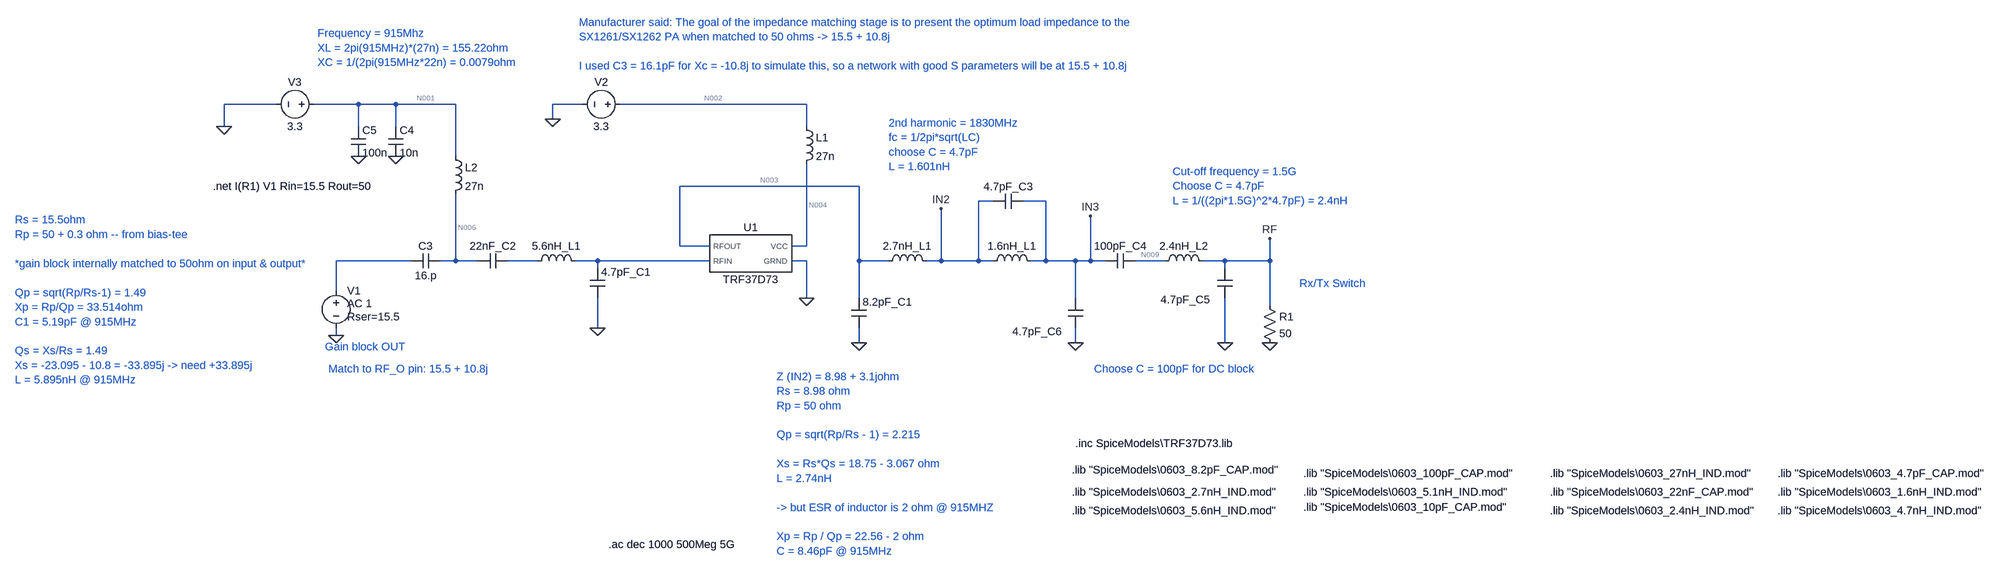
[diagram p0: schematic RF_FrontEnd_Real.asc]
RF_FrontEnd_Real.asc, the LTspice schematic file:
Version 4.1
SHEET 1 3572 756
WIRE -688 -208 -800 -208
WIRE -512 -208 -608 -208
WIRE -432 -208 -512 -208
WIRE -304 -208 -432 -208
WIRE -32 -208 -96 -208
WIRE 448 -208 48 -208
WIRE -96 -176 -96 -208
WIRE -800 -160 -800 -208
WIRE -512 -160 -512 -208
WIRE -432 -160 -432 -208
WIRE 448 -160 448 -208
WIRE -304 -96 -304 -208
WIRE 560 -32 176 -32
WIRE 848 0 816 0
WIRE 960 0 912 0
WIRE 176 96 176 -32
WIRE 240 96 176 96
WIRE 448 96 448 -80
WIRE 448 96 416 96
WIRE -400 128 -560 128
WIRE -304 128 -304 -16
WIRE -304 128 -336 128
WIRE -256 128 -304 128
WIRE -128 128 -192 128
WIRE 0 128 -48 128
WIRE 240 128 0 128
WIRE 448 128 416 128
WIRE 560 128 560 -32
WIRE 624 128 560 128
WIRE 736 128 736 16
WIRE 736 128 704 128
WIRE 816 128 816 0
WIRE 816 128 736 128
WIRE 848 128 816 128
WIRE 960 128 960 0
WIRE 960 128 928 128
WIRE 1024 128 960 128
WIRE 1056 128 1056 32
WIRE 1056 128 1024 128
WIRE 1088 128 1056 128
WIRE 1216 128 1152 128
WIRE 1344 128 1296 128
WIRE 1440 128 1440 80
WIRE 1440 128 1344 128
WIRE 0 144 0 128
WIRE 1344 144 1344 128
WIRE -560 192 -560 128
WIRE 448 208 448 128
WIRE 560 208 560 128
WIRE 1024 208 1024 128
WIRE 1440 224 1440 128
WIRE 0 272 0 208
WIRE -560 288 -560 272
WIRE 560 304 560 272
WIRE 1024 304 1024 272
WIRE 1344 304 1344 208
FLAG -560 288 0
FLAG 1440 304 0
FLAG 1440 80 RF
FLAG 1344 304 0
FLAG 1024 304 0
FLAG 1056 32 IN3
FLAG 560 304 0
FLAG 736 16 IN2
FLAG 448 208 0
FLAG -96 -176 0
FLAG 0 272 0
FLAG -800 -160 0
FLAG -512 -96 0
FLAG -432 -96 0
SYMBOL voltage -560 176 R0
WINDOW 3 -261 44 Left 2
WINDOW 123 24 44 Left 2
WINDOW 39 24 72 Left 2
SYMATTR Value ""
SYMATTR Value2 AC 1
SYMATTR SpiceLine Rser=15.5
SYMATTR InstName V1
SYMBOL res 1424 208 R0
SYMATTR InstName R1
SYMATTR Value 50
SYMBOL cap 912 -16 R90
WINDOW 0 0 32 VBottom 2
WINDOW 3 32 32 Invisible 2
SYMATTR InstName 4.7pF_C3
SYMATTR Value CL10C4R7BB8NNN_Precise_DC0V_25degC
SYMATTR Prefix X
SYMBOL ind 1200 144 R270
WINDOW 0 32 56 VTop 2
WINDOW 3 5 56 Invisible 2
SYMATTR InstName 2.4nH_L2
SYMATTR Value LQG18HN2N7S00
SYMATTR Prefix X
SYMATTR SpiceLine Rser=1m
SYMBOL cap 1328 144 R0
WINDOW 0 -122 67 Left 2
WINDOW 3 24 56 Invisible 2
SYMATTR InstName 4.7pF_C5
SYMATTR Value CL10C4R7BB8NNN_Precise_DC0V_25degC
SYMATTR Prefix X
SYMBOL cap 1152 112 R90
WINDOW 0 0 32 VBottom 2
WINDOW 3 32 32 Invisible 2
SYMATTR InstName 100pF_C4
SYMATTR Value GRM1555C1H101JA01_DC0V_25degC
SYMATTR Prefix X
SYMBOL cap 1008 208 R0
WINDOW 0 -119 72 Left 2
WINDOW 3 -49 69 Invisible 2
SYMATTR InstName 4.7pF_C6
SYMATTR Value CL10C4R7BB8NNN_Precise_DC0V_25degC
SYMATTR Prefix X
SYMBOL ind 832 144 R270
WINDOW 0 32 56 VTop 2
WINDOW 3 4 56 Invisible 2
SYMATTR InstName 1.6nH_L1
SYMATTR Value LQW18AS1N6J00
SYMATTR Prefix X
SYMBOL ind 608 144 R270
WINDOW 0 32 56 VTop 2
WINDOW 3 5 56 Invisible 2
SYMATTR InstName 2.7nH_L1
SYMATTR Value LQW15AN2N7B8Z
SYMATTR Prefix X
SYMBOL cap 544 208 R0
WINDOW 3 24 56 Invisible 2
SYMATTR Value GRM1885C1H8R2BA01_DC0V_25degC
SYMATTR InstName 8.2pF_C1
SYMATTR Prefix X
SYMBOL SpiceModels\\TRF37D73 320 112 R0
SYMATTR InstName U1
SYMBOL voltage 64 -208 R90
WINDOW 0 -32 56 VBottom 2
WINDOW 3 32 56 VTop 2
WINDOW 123 0 0 Left 0
WINDOW 39 0 0 Left 0
SYMATTR InstName V2
SYMATTR Value 3.3
SYMBOL cap -16 144 R0
WINDOW 3 24 56 Invisible 2
SYMATTR InstName 4.7pF_C1
SYMATTR Value CL10C4R7BB8NNN_Precise_DC0V_25degC
SYMATTR Prefix X
SYMBOL ind -144 144 R270
WINDOW 0 32 56 VTop 2
WINDOW 3 5 56 Invisible 2
SYMATTR InstName 5.6nH_L1
SYMATTR Value LQG18HN5N6S00
SYMATTR Prefix X
SYMATTR SpiceLine Rser=1m
SYMBOL cap -192 112 R90
WINDOW 0 0 32 VBottom 2
WINDOW 3 32 32 Invisible 2
SYMATTR InstName 22nF_C2
SYMATTR Value CL10B223KB8NNN_Precise_DC0V_25degC
SYMATTR Prefix X
SYMBOL cap -336 112 R90
WINDOW 0 0 32 VBottom 2
WINDOW 3 32 32 VTop 2
SYMATTR InstName C3
SYMATTR Value 16.p
SYMBOL ind -320 -112 R0
SYMATTR InstName L2
SYMATTR Value 27n
SYMATTR SpiceLine Rser=1m
SYMBOL cap -448 -160 R0
SYMATTR InstName C4
SYMATTR Value 10n
SYMBOL cap -528 -160 R0
SYMATTR InstName C5
SYMATTR Value 100n
SYMBOL voltage -592 -208 R90
WINDOW 0 -32 56 VBottom 2
WINDOW 3 32 56 VTop 2
WINDOW 123 0 0 Left 0
WINDOW 39 0 0 Left 0
SYMATTR InstName V3
SYMATTR Value 3.3
SYMBOL ind 432 -176 R0
SYMATTR InstName L1
SYMATTR Value 27n
SYMATTR SpiceLine Rser=1m
TEXT 2040 624 Left 2 !.lib "SpiceModels\\0603_22nF_CAP.mod"
TEXT 2040 584 Left 2 !.lib "SpiceModels\\0603_27nH_IND.mod"
TEXT 624 -168 Left 2 ;2nd harmonic = 1830MHz\nfc = 1/2pi*sqrt(LC)\nchoose C = 4.7pF\nL = 1.601nH
TEXT 2040 664 Left 2 !.lib "SpiceModels\\0603_2.4nH_IND.mod"
TEXT 2528 584 Left 2 !.lib "SpiceModels\\0603_4.7pF_CAP.mod"
TEXT 2528 624 Left 2 !.lib "SpiceModels\\0603_1.6nH_IND.mod"
TEXT 2528 664 Left 2 !.lib "SpiceModels\\0603_4.7nH_IND.mod"
TEXT 1512 584 Left 2 !.lib "SpiceModels\\0603_100pF_CAP.mod"
TEXT 1512 624 Left 2 !.lib "SpiceModels\\0603_5.1nH_IND.mod"
TEXT 1512 656 Left 2 !.lib "SpiceModels\\0603_10pF_CAP.mod"
TEXT 1016 576 Left 2 !.lib "SpiceModels\\0603_8.2pF_CAP.mod"
TEXT 384 376 Left 2 ;Z (IN2) = 8.98 + 3.1johm\nRs = 8.98 ohm\nRp = 50 ohm\n \nQp = sqrt(Rp/Rs - 1) = 2.215\n \nXs = Rs*Qs = 18.75 - 3.067 ohm\nL = 2.74nH\n \n-> but ESR of inductor is 2 ohm @ 915MHZ\n \nXp = Rp / Qp = 22.56 - 2 ohm\nC = 8.46pF @ 915MHz
TEXT 1232 -64 Left 2 ;Cut-off frequency = 1.5G\nChoose C = 4.7pF\nL = 1/((2pi*1.5G)^2*4.7pF) = 2.4nH
TEXT 1064 360 Left 2 ;Choose C = 100pF for DC block
TEXT 1016 624 Left 2 !.lib "SpiceModels\\0603_2.7nH_IND.mod"
TEXT -584 312 Left 2 ;Gain block OUT
TEXT 1504 176 Left 2 ;Rx/Tx Switch
TEXT -824 -32 Left 2 !.net I(R1) V1 Rin=15.5 Rout=50
TEXT 1024 520 Left 2 !.inc SpiceModels\\TRF37D73.lib
TEXT 24 736 Left 2 !.ac dec 1000 500Meg 5G
TEXT 1016 664 Left 2 !.lib "SpiceModels\\0603_5.6nH_IND.mod"
TEXT -1248 40 Left 2 ;Rs = 15.5ohm\nRp = 50 + 0.3 ohm -- from bias-tee\n \n*gain block internally matched to 50ohm on input & output*\n \nQp = sqrt(Rp/Rs-1) = 1.49\nXp = Rp/Qp = 33.514ohm\nC1 = 5.19pF @ 915MHz\n \nQs = Xs/Rs = 1.49\nXs = -23.095 - 10.8 = -33.895j -> need +33.895j\nL = 5.895nH @ 915MHz
TEXT -600 -360 Left 2 ;Frequency = 915Mhz\nXL = 2pi(915MHz)*(27n) = 155.22ohm\nXC = 1/(2pi(915MHz*22n) = 0.0079ohm
TEXT -576 360 Left 2 ;Match to RF_O pin: 15.5 + 10.8j
TEXT -40 -384 Left 2 ;Manufacturer said: The goal of the impedance matching stage is to present the optimum load impedance to the\nSX1261/SX1262 PA when matched to 50 ohms -> 15.5 + 10.8j\n \nI used C3 = 16.1pF for Xc = -10.8j to simulate this, so a network with good S parameters will be at 15.5 + 10.8j

The netlist it stands for:
* RF_FrontEnd_Real.asc
V1 N005 0 AC 1 Rser=15.5
R1 RF 0 50
X§4.7pF_C3 IN3 IN2 CL10C4R7BB8NNN_Precise_DC0V_25degC  ; pins A B
X§2.4nH_L2 N009 RF LQG18HN2N7S00 Rser=1m  ; pins A B
X§4.7pF_C5 RF 0 CL10C4R7BB8NNN_Precise_DC0V_25degC  ; pins A B
X§100pF_C4 N009 IN3 GRM1555C1H101JA01_DC0V_25degC  ; pins A B
X§4.7pF_C6 IN3 0 CL10C4R7BB8NNN_Precise_DC0V_25degC  ; pins A B
X§1.6nH_L1 IN2 IN3 LQW18AS1N6J00  ; pins A B
X§2.7nH_L1 N003 IN2 LQW15AN2N7B8Z  ; pins A B
X§8.2pF_C1 N003 0 GRM1885C1H8R2BA01_DC0V_25degC  ; pins A B
X§U1 N003 N008 N004 0 TRF37D73  ; pins RFOUT RFIN VCC GRND
V2 N002 0 3.3
X§4.7pF_C1 N008 0 CL10C4R7BB8NNN_Precise_DC0V_25degC  ; pins A B
X§5.6nH_L1 N007 N008 LQG18HN5N6S00 Rser=1m  ; pins A B
X§22nF_C2 N007 N006 CL10B223KB8NNN_Precise_DC0V_25degC  ; pins A B
C3 N006 N005 16.p
L2 N001 N006 27n Rser=1m
C4 N001 0 10n
C5 N001 0 100n
V3 N001 0 3.3
L1 N002 N004 27n Rser=1m
.lib "SpiceModels\0603_22nF_CAP.mod"
.lib "SpiceModels\0603_27nH_IND.mod"
* 2nd harmonic = 1830MHz
* fc = 1/2pi*sqrt(LC)
* choose C = 4.7pF
* L = 1.601nH
.lib "SpiceModels\0603_2.4nH_IND.mod"
.lib "SpiceModels\0603_4.7pF_CAP.mod"
.lib "SpiceModels\0603_1.6nH_IND.mod"
.lib "SpiceModels\0603_4.7nH_IND.mod"
.lib "SpiceModels\0603_100pF_CAP.mod"
.lib "SpiceModels\0603_5.1nH_IND.mod"
.lib "SpiceModels\0603_10pF_CAP.mod"
.lib "SpiceModels\0603_8.2pF_CAP.mod"
* Z (IN2) = 8.98 + 3.1johm
* Rs = 8.98 ohm
* Rp = 50 ohm
* Qp = sqrt(Rp/Rs - 1) = 2.215
* Xs = Rs*Qs = 18.75 - 3.067 ohm
* L = 2.74nH
* -> but ESR of inductor is 2 ohm @ 915MHZ
* Xp = Rp / Qp = 22.56 - 2 ohm
* C = 8.46pF @ 915MHz
* Cut-off frequency = 1.5G
* Choose C = 4.7pF
* L = 1/((2pi*1.5G)^2*4.7pF) = 2.4nH
* Choose C = 100pF for DC block
.lib "SpiceModels\0603_2.7nH_IND.mod"
* Gain block OUT
* Rx/Tx Switch
.net I(R1) V1 Rin=15.5 Rout=50
.inc SpiceModels\TRF37D73.lib
.ac dec 1000 500Meg 5G
.lib "SpiceModels\0603_5.6nH_IND.mod"
* Rs = 15.5ohm
* Rp = 50 + 0.3 ohm -- from bias-tee
* *gain block internally matched to 50ohm on input & output*
* Qp = sqrt(Rp/Rs-1) = 1.49
* Xp = Rp/Qp = 33.514ohm
* C1 = 5.19pF @ 915MHz
* Qs = Xs/Rs = 1.49
* Xs = -23.095 - 10.8 = -33.895j -> need +33.895j
* L = 5.895nH @ 915MHz
* Frequency = 915Mhz
* XL = 2pi(915MHz)*(27n) = 155.22ohm
* XC = 1/(2pi(915MHz*22n) = 0.0079ohm
* Match to RF_O pin: 15.5 + 10.8j
* Manufacturer said: The goal of the impedance matching stage is to present the optimum load impedance to the
* SX1261/SX1262 PA when matched to 50 ohms -> 15.5 + 10.8j
* I used C3 = 16.1pF for Xc = -10.8j to simulate this, so a network with good S parameters will be at 15.5 + 10.8j
.backanno
.end

* Results of the author's LTspice run, read from the files saved beside the schematic
* Operating Point, zero values left out:
*   V(in2) = -242.9 MV
*   V(in3) = -242.9 MV
*   V(n001) = 3.3 V
*   V(n002) = 3.3 V
*   V(n003) = -242.9 MV
*   V(n004) = 3.3 V
*   V(n006) = 3.3 V
*   V(n009) = -1.216 V
*   V(rf) = -1.214 V
*   I(L1) = 4.4 mA
*   I(L2) = 33 nA
*   I(R1) = -24.29 mA
*   I(V2) = -4.4 mA
*   I(V3) = -33 nA
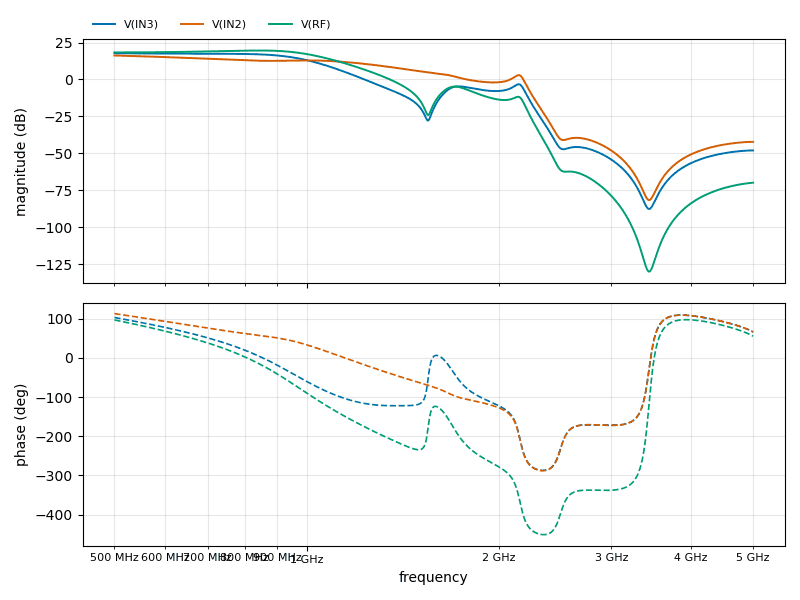
[diagram p1: AC Analysis of RF_FrontEnd_Real.asc, plotted from the saved traces]
* AC Analysis, 1 run:
*   V(IN3): 17.75 dB at 500 MHz, -48.04 dB at 5 GHz, peak 17.75 dB at 500 MHz, 3 dB below the peak at 956.5 MHz
*   V(IN2): 16.22 dB at 500 MHz, -42.23 dB at 5 GHz, peak 16.22 dB at 500 MHz, 3 dB below the peak at 771.4 MHz
*   V(RF): 18.31 dB at 500 MHz, -69.90 dB at 5 GHz, peak 19.60 dB at 841.3 MHz, 3 dB below the peak at 1.018 GHz